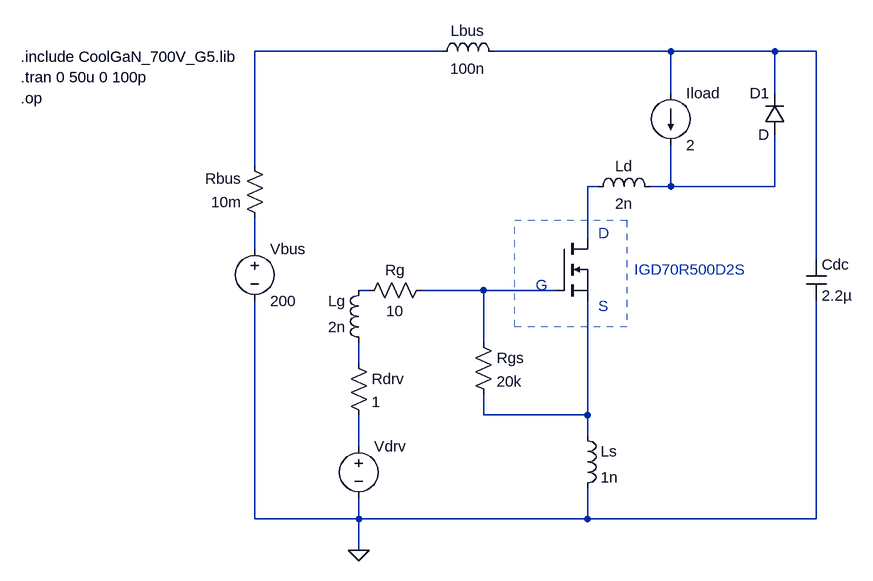
[diagram p0: schematic Transient_Switching_Analysis.asc]
Transient_Switching_Analysis.asc, the LTspice schematic file:
Version 4
SHEET 1 880 976
WIRE -64 192 -352 192
WIRE 288 192 16 192
WIRE 448 192 288 192
WIRE 512 192 448 192
WIRE 288 256 288 192
WIRE 448 256 448 192
WIRE -352 368 -352 192
WIRE 176 400 160 400
WIRE 288 400 288 336
WIRE 288 400 256 400
WIRE 448 400 448 320
WIRE 448 400 288 400
WIRE 160 480 160 400
WIRE -352 496 -352 448
WIRE 512 512 512 192
WIRE -176 560 -192 560
WIRE 0 560 -96 560
WIRE 112 560 0 560
WIRE 0 640 0 560
WIRE -192 672 -192 640
WIRE 0 752 0 720
WIRE 160 752 160 576
WIRE 160 752 0 752
WIRE 160 784 160 752
WIRE -192 800 -192 752
WIRE -352 912 -352 576
WIRE -192 912 -192 880
WIRE -192 912 -352 912
WIRE 160 912 160 864
WIRE 160 912 -192 912
WIRE 512 912 512 576
WIRE 512 912 160 912
WIRE -192 960 -192 912
FLAG -192 960 0
SYMBOL nmos 112 480 R0
WINDOW 0 56 32 Invisible 2
WINDOW 3 56 72 Invisible 2
SYMATTR InstName X1
SYMATTR Value IGD70R500D2S_L1
SYMATTR Prefix X
SYMBOL Res -80 544 R90
WINDOW 0 0 56 VBottom 2
WINDOW 3 32 56 VTop 2
SYMATTR InstName Rg
SYMATTR Value 10
SYMBOL Voltage -352 480 R0
SYMATTR InstName Vbus
SYMATTR Value 200
SYMATTR SpiceLine Rser=1m
SYMBOL Voltage -192 784 R0
WINDOW 3 24 96 Invisible 2
SYMATTR Value PULSE(0 6 1n 1n 1n 500n 1u)
SYMATTR InstName Vdrv
SYMBOL current 288 256 R0
SYMATTR InstName Iload
SYMATTR Value 2
SYMBOL Diode 464 320 R180
WINDOW 0 24 64 Left 2
WINDOW 3 24 0 Left 2
SYMATTR InstName D1
SYMBOL ind -80 208 R270
WINDOW 0 32 56 VTop 2
WINDOW 3 5 56 VBottom 2
SYMATTR InstName Lbus
SYMATTR Value 100n
SYMBOL Res -336 464 R180
WINDOW 0 36 76 Left 2
WINDOW 3 36 40 Left 2
SYMATTR InstName Rbus
SYMATTR Value 10m
SYMBOL ind 144 768 R0
SYMATTR InstName Ls
SYMATTR Value 1n
SYMBOL ind 160 416 R270
WINDOW 0 32 56 VTop 2
WINDOW 3 5 56 VBottom 2
SYMATTR InstName Ld
SYMATTR Value 2n
SYMBOL ind -176 656 R180
WINDOW 0 36 80 Left 2
WINDOW 3 36 40 Left 2
SYMATTR InstName Lg
SYMATTR Value 2n
SYMBOL Res -208 656 R0
SYMATTR InstName Rdrv
SYMATTR Value 1
SYMBOL Res -16 624 R0
SYMATTR InstName Rgs
SYMATTR Value 20k
SYMBOL Cap 496 512 R0
SYMATTR InstName Cdc
SYMATTR Value 2.2µ
TEXT -712 200 Left 2 !.include CoolGaN_700V_G5.lib
TEXT -712 264 Left 2 !.op
TEXT -712 232 Left 2 !.tran 0 50u 0 100p
TEXT 176 472 Left 2 ;D
TEXT 176 584 Left 2 ;S
TEXT 80 552 Left 2 ;G
TEXT 232 528 Left 2 ;IGD70R500D2S
RECTANGLE Normal 48 452 220 616 2

The netlist it stands for:
* Transient_Switching_Analysis.asc
XX1 N003 N007 N009 IGD70R500D2S_L1  ; pins D G S
Rg N007 N006 10
Vbus N005 0 200 Rser=1m
Vdrv N010 0 PULSE(0 6 1n 1n 1n 500n 1u)
Iload N002 N004 2
D1 N004 N002 D
Lbus N001 N002 100n
Rbus N005 N001 10m
Ls N009 0 1n
Ld N003 N004 2n
Lg N008 N006 2n
Rdrv N008 N010 1
Rgs N007 N009 20k
Cdc N002 0 2.2µ
.model D D
.lib standard.dio
.include CoolGaN_700V_G5.lib
.op
.tran 0 50u 0 100p
* D
* S
* G
* IGD70R500D2S
.backanno
.end